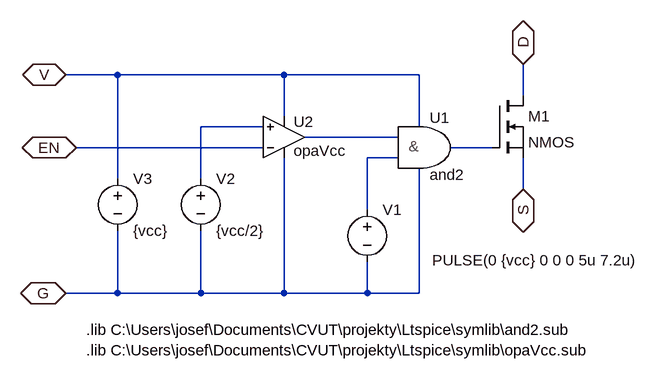
[diagram p0: schematic TNY26x.asc]
TNY26x.asc, the LTspice schematic file:
Version 4.1
SHEET 1 880 680
WIRE -176 -48 -256 -48
WIRE 80 -48 -176 -48
WIRE 288 -48 80 -48
WIRE 448 -16 448 -64
WIRE 80 16 80 -48
WIRE 48 32 -48 32
WIRE 288 32 288 -48
WIRE 256 48 112 48
WIRE 48 64 -240 64
WIRE 400 64 336 64
WIRE 256 80 208 80
WIRE -176 112 -176 -48
WIRE -48 112 -48 32
WIRE 448 128 448 80
WIRE 208 160 208 80
WIRE -176 288 -176 192
WIRE -176 288 -256 288
WIRE -48 288 -48 192
WIRE -48 288 -176 288
WIRE 80 288 80 80
WIRE 80 288 -48 288
WIRE 208 288 208 240
WIRE 208 288 80 288
WIRE 288 288 288 96
WIRE 288 288 208 288
FLAG -240 64 EN
IOPIN -240 64 BiDir
FLAG -256 288 G
IOPIN -256 288 BiDir
FLAG 448 -64 D
IOPIN 448 -64 BiDir
FLAG 448 128 S
IOPIN 448 128 BiDir
FLAG -256 -48 V
IOPIN -256 -48 BiDir
SYMBOL and2 288 64 R0
SYMATTR InstName U1
SYMBOL opaVcc 80 48 R0
SYMATTR InstName U2
SYMBOL voltage 208 144 R0
WINDOW 3 100 93 Left 2
WINDOW 123 0 0 Left 0
WINDOW 39 0 0 Left 0
SYMATTR InstName V1
SYMATTR Value PULSE(0 {vcc} 0 0 0 5u 7.2u)
SYMBOL nmos 400 -16 R0
SYMATTR InstName M1
SYMBOL voltage -48 96 R0
WINDOW 123 0 0 Left 0
WINDOW 39 0 0 Left 0
SYMATTR InstName V2
SYMATTR Value {vcc/2}
SYMBOL voltage -176 96 R0
WINDOW 123 0 0 Left 0
WINDOW 39 0 0 Left 0
SYMATTR InstName V3
SYMATTR Value {vcc}
TEXT -224 376 Left 2 !.lib C:\\Users\\josef\\Documents\\CVUT\\projekty\\Ltspice\\symlib\\opaVcc.sub
TEXT -224 344 Left 2 !.lib C:\\Users\\josef\\Documents\\CVUT\\projekty\\Ltspice\\symlib\\and2.sub

The netlist it stands for:
* TNY26x.asc
X§U1 N002 N004 N003 V G and2  ; pins A B Y Vcc Vee
X§U2 EN N001 N002 V G opaVcc  ; pins Vin Vip Vo Vcc Vee
V1 N004 G PULSE(0 {vcc} 0 0 0 5u 7.2u)
M1 D N003 S S NMOS
V2 N001 G {vcc/2}
V3 V G {vcc}
.model NMOS NMOS
.model PMOS PMOS
.lib standard.mos
.lib C:\Users\josef\Documents\CVUT\projekty\Ltspice\symlib\opaVcc.sub
.lib C:\Users\josef\Documents\CVUT\projekty\Ltspice\symlib\and2.sub
.backanno
.end